# Altium schematic sheet ESP32_S2_solo.SchDoc
size A4; Engineer: Naif Aljohani; DocumentNumber: 3; Revision: v1.0; SheetNumber: 2; SheetTotal: 7; SPICEModelCacheSFRKXKUM: <root> / <DocumentId>SFRKXKUM</DocumentId> / </root>
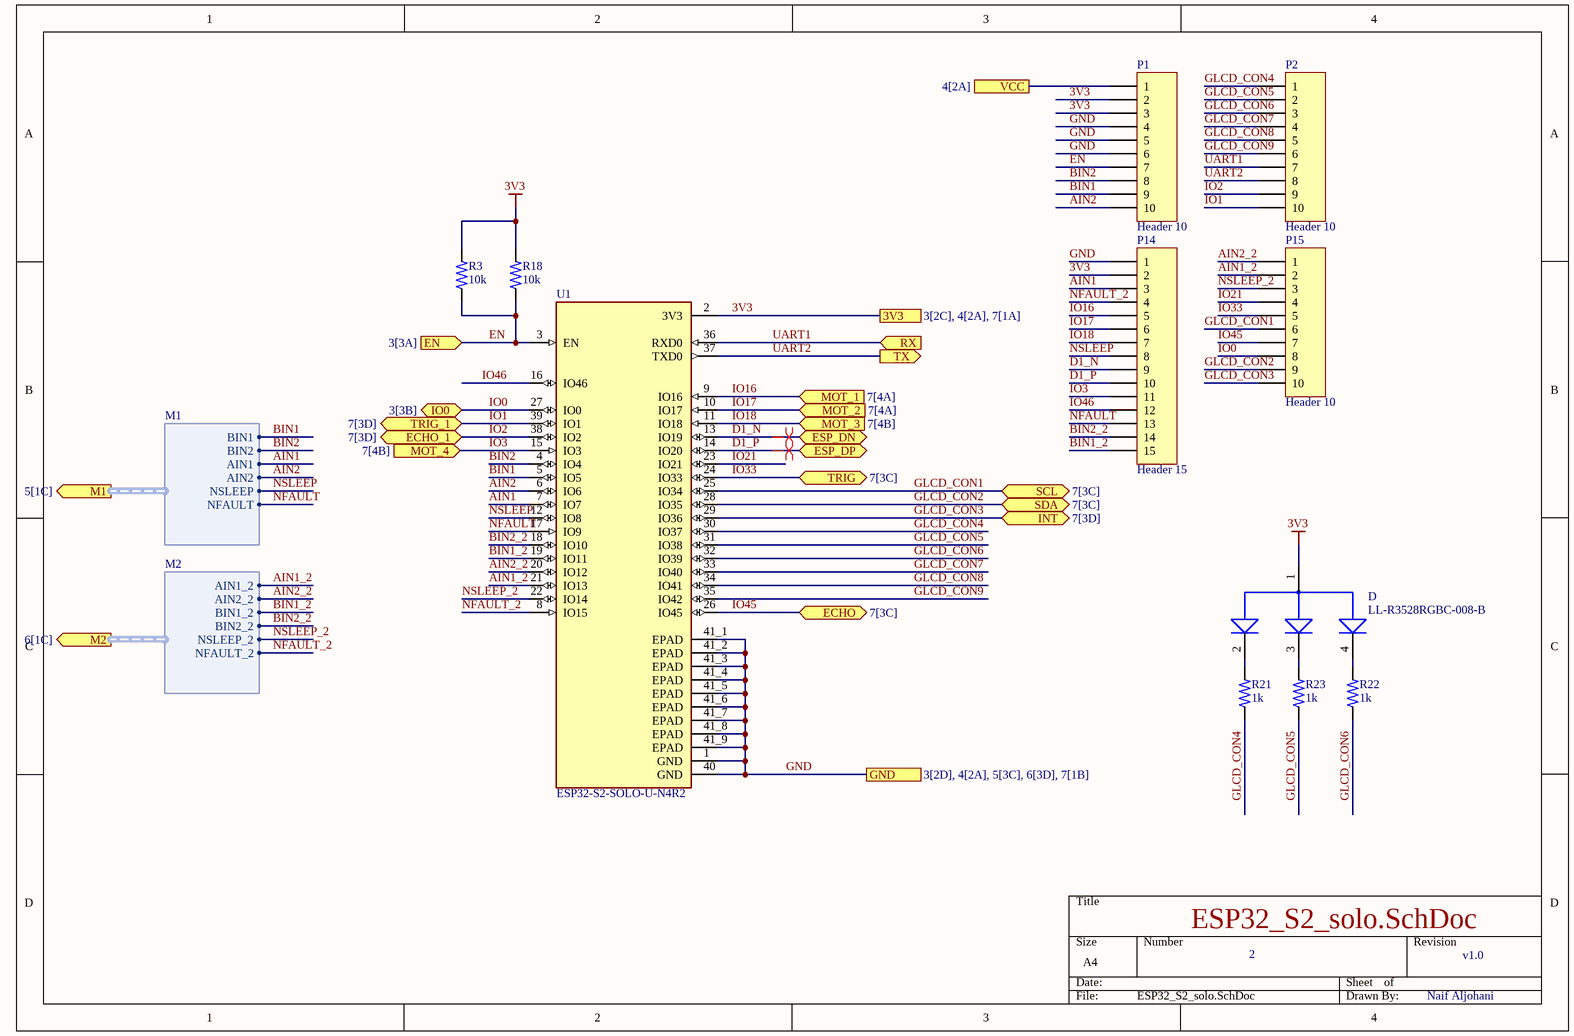
[diagram p0: ESP32_S2_solo.SchDoc]

## Parts
D  LL-R3528RGBC-008-B  [LED_LL-R3528RGBC-008-B]
P1  Header 10  [HDR1X10]
P2  Header 10  [HDR1X10]
P14  Header 15  [HDR1X15]
P15  Header 10  [HDR1X10]
R3  10k  [RESC3115X65N]
R18  10k  [RESC3115X65N]
R21  1k  [RESC3115X65N]
R22  1k  [RESC3115X65N]
R23  1k  [RESC3115X65N]
U1  ESP32-S2-SOLO-U-N4R2  [XCVR_ESP32-S2-SOLO-U-N4R2]

## Ports
3V3 (see 3[2C], 4[2A], 7[1A]), ECHO (bidir, see 7[3C]), ECHO_1 (bidir, see 7[3D]), EN (in, see 3[3A]), ESP_DN (bidir), ESP_DP (bidir), GND (see 3[2D], 4[2A], 5[3C], 6[3D], 7[1B]), INT (bidir, see 7[3D]), IO0 (bidir, see 3[3B]), M1 (out, harness M1, see 5[1C]), M2 (out, harness M2, see 6[1C]), MOT_1 (in, see 7[4A]), MOT_2 (in, see 7[4A]), MOT_3 (in, see 7[4B]), MOT_4 (in, see 7[4B]), RX (in), SCL (bidir, see 7[3C]), SDA (bidir, see 7[3C]), TRIG (bidir, see 7[3C]), TRIG_1 (bidir, see 7[3D]), TX (out), VCC (see 4[2A])

## Harnesses
M1: BIN1, BIN2, AIN1, AIN2, NSLEEP, NFAULT
M2: AIN1_2, AIN2_2, BIN1_2, BIN2_2, NSLEEP_2, NFAULT_2

## Nets
3V3: D.1(COMM_ANODE) P1.2 P1.3 P14.2 R3.2 R18.2 U1.2(3V3) ; port 3V3
AIN1: P14.3 U1.7(IO7) ; port M1.AIN1
AIN1_2: P15.2 U1.21(IO13) ; port M2.AIN1_2
AIN2: P1.10 U1.6(IO6) ; port M1.AIN2
AIN2_2: P15.1 U1.20(IO12) ; port M2.AIN2_2
BIN1: P1.9 U1.5(IO5) ; port M1.BIN1
BIN1_2: P14.15 U1.19(IO11) ; port M2.BIN1_2
BIN2: P1.8 U1.4(IO4) ; port M1.BIN2
BIN2_2: P14.14 U1.18(IO10) ; port M2.BIN2_2
D1_N: P14.9 U1.13(IO19) ; port ESP_DN
D1_P: P14.10 U1.14(IO20) ; port ESP_DP
EN: P1.7 R3.1 R18.1 U1.3(EN) ; port EN
GLCD_CON1: P15.6 U1.25(IO34) ; port SCL
GLCD_CON2: P15.9 U1.28(IO35) ; port SDA
GLCD_CON3: P15.10 U1.29(IO36) ; port INT
GLCD_CON4: P2.1 R21.1 U1.30(IO37)
GLCD_CON5: P2.2 R23.1 U1.31(IO38)
GLCD_CON6: P2.3 R22.1 U1.32(IO39)
GLCD_CON7: P2.4 U1.33(IO40)
GLCD_CON8: P2.5 U1.34(IO41)
GLCD_CON9: P2.6 U1.35(IO42)
GND: P1.4 P1.5 P1.6 P14.1 U1.1(GND) U1.40(GND) U1.41_1(EPAD) U1.41_2(EPAD) U1.41_3(EPAD) U1.41_4(EPAD) U1.41_5(EPAD) U1.41_6(EPAD) U1.41_7(EPAD) U1.41_8(EPAD) U1.41_9(EPAD) ; port GND
IO0: P15.8 U1.27(IO0) ; port IO0
IO1: P2.10 U1.39(IO1) ; port TRIG_1
IO2: P2.9 U1.38(IO2) ; port ECHO_1
IO3: P14.11 U1.15(IO3) ; port MOT_4
IO16: P14.5 U1.9(IO16) ; port MOT_1
IO17: P14.6 U1.10(IO17) ; port MOT_2
IO18: P14.7 U1.11(IO18) ; port MOT_3
IO21: P15.4 U1.23(IO21)
IO33: P15.5 U1.24(IO33) ; port TRIG
IO45: P15.7 U1.26(IO45) ; port ECHO
IO46: P14.12 U1.16(IO46)
NFAULT: P14.13 U1.17(IO9) ; port M1.NFAULT
NFAULT_2: P14.4 U1.8(IO15) ; port M2.NFAULT_2
NSLEEP: P14.8 U1.12(IO8) ; port M1.NSLEEP
NSLEEP_2: P15.3 U1.22(IO14) ; port M2.NSLEEP_2
UART1: P2.7 U1.36(RXD0) ; port RX
UART2: P2.8 U1.37(TXD0) ; port TX
VCC: P1.1 ; port VCC
NetD_2: D.2(CATHODE_RED) R21.2
NetD_3: D.3(CATHODE_GREEN) R23.2
NetD_4: D.4(CATHODE_BLUE) R22.2

## Layout directives
differential pair: D1_N, D1_P

## Library data of the parts
D = LL-R3528RGBC-008-B: LED; SMD; 3528, PLCC2; RGB; 3.5x2.8mm; 120Â°; Red lumin: 1; MF: Lucky Light; Package: PLCC-2 Lucky Light; Availability: Unavailable; Value: *; MP: LL-R3528RGBC-008-B; SnapEDA_Link: https://www.snapeda.com/parts/LL-R3528RGBC-008-B/Lucky%20Light/view-part/47649/?ref=snap; Price: None
P1 P2 P15 = Header 10: Header, 10-Pin; LatestRevisionDate: 17-Jul-2002; LatestRevisionNote: Re-released for DXP Platform.; Publisher: Altium Limited
P14 = Header 15: Header, 15-Pin; LatestRevisionDate: 17-Jul-2002; LatestRevisionNote: Re-released for DXP Platform.; Publisher: Altium Limited
R3 R18 R21-R23 = 1-1879462-4: RL73H 2B R43 1% 5K RL; MF: {'manufacturer': u'TE Connectivity'}; Package: None; Price: None; Value: *; MP: 1-1879462-4; Availability: Unavailable
U1 = ESP32-S2-SOLO-U-N4R2: MF: {'manufacturer': u'Espressif Systems'}; Package: None; Price: None; MP: ESP32-S2-SOLO-U-N4R2; Availability: Unavailable; Value: *